# Altium project Main_Board.PrjPcb (part 9 of 44)

## Sheet JESD204_B_or_C.SchDoc: JESD204_B
size A3; Organization: Altium Limited; Address1: L3, 12a Rodborough Rd; Address2: Frenchs Forest; Address3: NSW; Address4: Australia 2086
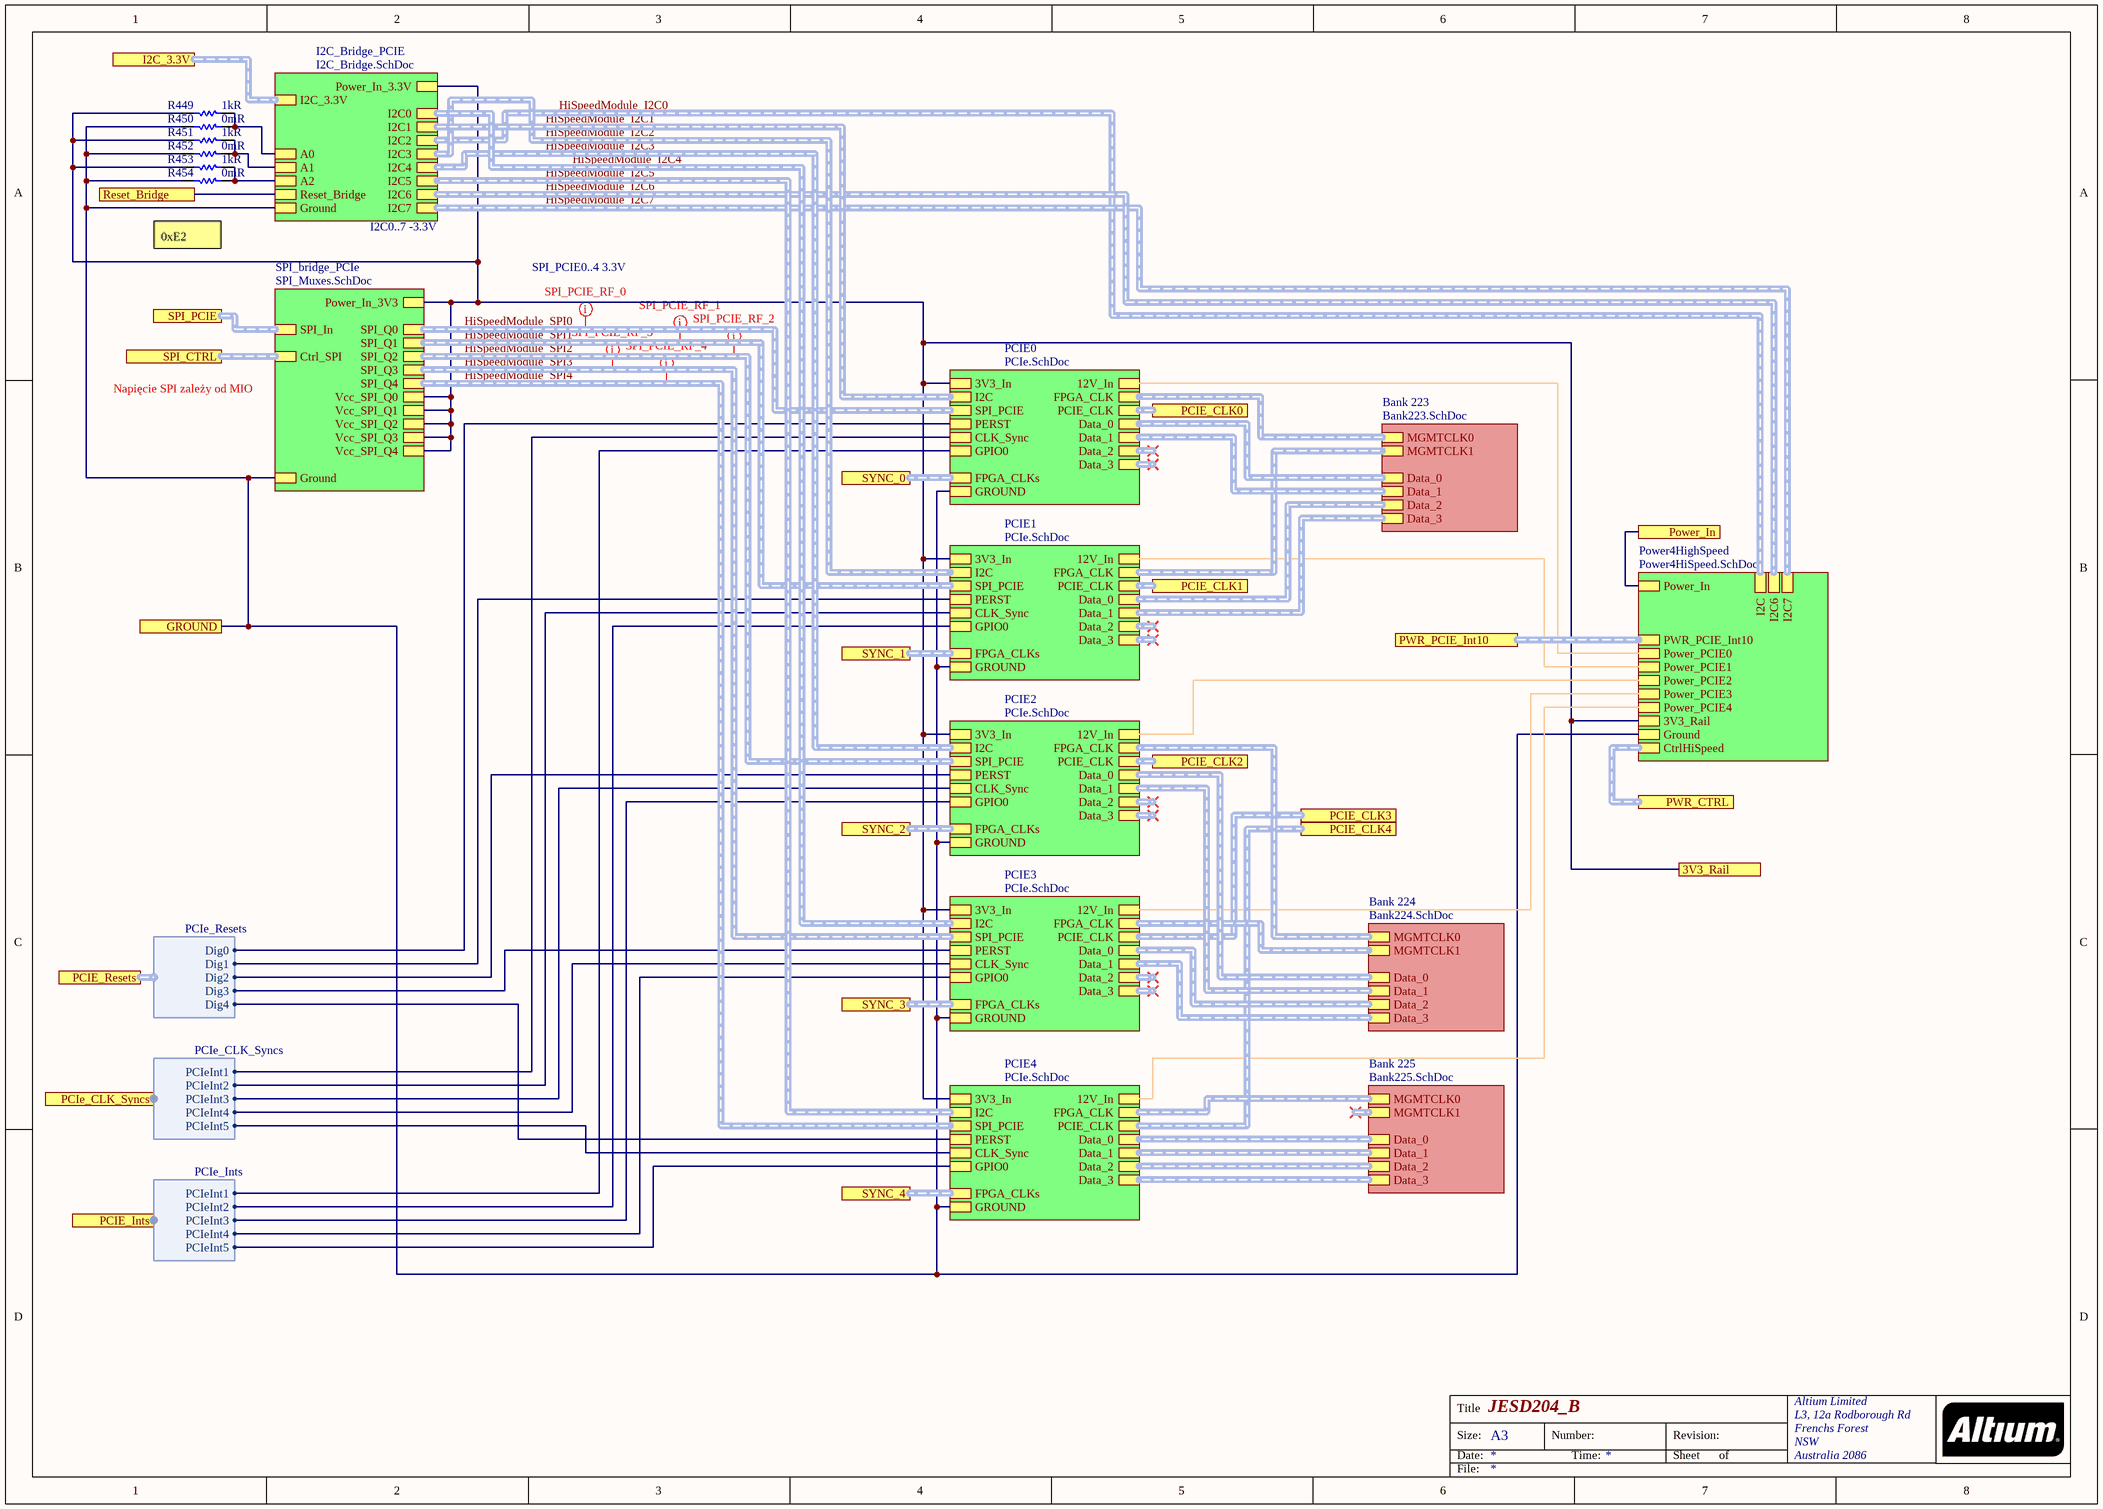
[diagram p11: JESD204_B_or_C.SchDoc]

### Parts
R449  1kR  [RES 0402/1005 RF KK]
R450  0mR  [RES 0402/1005 RF KK]
R451  1kR  [RES 0402/1005 RF KK]
R452  0mR  [RES 0402/1005 RF KK]
R453  1kR  [RES 0402/1005 RF KK]
R454  0mR  [RES 0402/1005 RF KK]

### Sub-sheets
Bank 223 = Bank223.SchDoc: MGMTCLK0 (harness Diff_1Pair), MGMTCLK1 (harness Diff_1Pair), Data_3 (harness Diff_2PairData), Data_2 (harness Diff_2PairData), Data_1 (harness Diff_2PairData), Data_0 (harness Diff_2PairData)
Bank 224 = Bank224.SchDoc: MGMTCLK0 (harness Diff_1Pair), MGMTCLK1 (harness Diff_1Pair), Data_3 (harness Diff_2PairData), Data_2 (harness Diff_2PairData), Data_1 (harness Diff_2PairData), Data_0 (harness Diff_2PairData)
Bank 225 = Bank225.SchDoc: Data_3 (harness Diff_2PairData), MGMTCLK0 (harness Diff_1Pair), Data_2 (harness Diff_2PairData), Data_1 (harness Diff_2PairData), Data_0 (harness Diff_2PairData), MGMTCLK1 (harness Diff_1Pair)
I2C_Bridge_PCIE = I2C_Bridge.SchDoc: I2C0 (harness I2C), I2C1 (harness I2C), I2C2 (harness I2C), I2C3 (harness I2C), I2C4 (harness I2C), I2C5 (harness I2C), I2C6 (harness I2C), I2C7 (harness I2C), Ground, A2, A1, A0, I2C_3.3V (harness I2C), Reset_Bridge, Power_In_3.3V
PCIE0 = PCIe.SchDoc: 12V_In, I2C (harness I2C), PERST, Data_0 (harness Diff_2PairData), Data_1 (harness Diff_2PairData), Data_2 (harness Diff_2PairData), Data_3 (harness Diff_2PairData), SPI_PCIE (harness SPI_H), 3V3_In, GROUND, FPGA_CLKs (harness Diff_3Diff_Pcie), PCIE_CLK (harness Diff_1Pair), CLK_Sync, GPIO0, FPGA_CLK (harness Diff_1Pair)
PCIE1 = PCIe.SchDoc: 12V_In, I2C (harness I2C), PCIE_CLK (harness Diff_1Pair), PERST, Data_0 (harness Diff_2PairData), Data_1 (harness Diff_2PairData), Data_2 (harness Diff_2PairData), Data_3 (harness Diff_2PairData), SPI_PCIE (harness SPI_H), 3V3_In, GROUND, FPGA_CLKs (harness Diff_3Diff_Pcie), CLK_Sync, GPIO0, FPGA_CLK (harness Diff_1Pair)
PCIE2 = PCIe.SchDoc: 12V_In, I2C (harness I2C), PCIE_CLK (harness Diff_1Pair), PERST, Data_0 (harness Diff_2PairData), Data_1 (harness Diff_2PairData), Data_2 (harness Diff_2PairData), Data_3 (harness Diff_2PairData), SPI_PCIE (harness SPI_H), 3V3_In, GROUND, FPGA_CLKs (harness Diff_3Diff_Pcie), CLK_Sync, GPIO0, FPGA_CLK (harness Diff_1Pair)
PCIE3 = PCIe.SchDoc: 12V_In, I2C (harness I2C), PCIE_CLK (harness Diff_1Pair), PERST, Data_0 (harness Diff_2PairData), Data_1 (harness Diff_2PairData), Data_2 (harness Diff_2PairData), Data_3 (harness Diff_2PairData), SPI_PCIE (harness SPI_H), 3V3_In, GROUND, FPGA_CLKs (harness Diff_3Diff_Pcie), CLK_Sync, GPIO0, FPGA_CLK (harness Diff_1Pair)
PCIE4 = PCIe.SchDoc: 12V_In, I2C (harness I2C), PCIE_CLK (harness Diff_1Pair), PERST, Data_0 (harness Diff_2PairData), Data_1 (harness Diff_2PairData), Data_2 (harness Diff_2PairData), Data_3 (harness Diff_2PairData), SPI_PCIE (harness SPI_H), 3V3_In, FPGA_CLKs (harness Diff_3Diff_Pcie), GROUND, CLK_Sync, GPIO0, FPGA_CLK (harness Diff_1Pair)
Power4HighSpeed = Power4HiSpeed.SchDoc: Power_In, Power_PCIE0, Power_PCIE1, Power_PCIE2, Power_PCIE3, Power_PCIE4, CtrlHiSpeed (harness Ctrl_Pwr4HiSpeed), Ground, I2C (harness I2C), 3V3_Rail, PWR_PCIE_Int10 (harness PWR_PCIE_Int10), I2C6, I2C7
SPI_bridge_PCIe = SPI_Muxes.SchDoc: SPI_Q0 (harness SPI_H), SPI_Q1 (harness SPI_H), SPI_Q2 (harness SPI_H), SPI_Q3 (harness SPI_H), SPI_Q4 (harness SPI_H), SPI_In (harness SPI_H), Power_In_3V3, Ctrl_SPI (harness Ctrl_SPI_PCIE), Vcc_SPI_Q4, Vcc_SPI_Q3, Vcc_SPI_Q2, Vcc_SPI_Q1, Vcc_SPI_Q0, Ground

### Ports
3V3_Rail, GROUND, I2C_3.3V (harness I2C), PCIE_CLK0 (harness Diff_1Pair), PCIE_CLK1 (harness Diff_1Pair), PCIE_CLK2 (harness Diff_1Pair), PCIE_CLK3 (harness Diff_1Pair), PCIE_CLK4 (harness Diff_1Pair), PCIe_CLK_Syncs (harness PCIe_CLK_Syncs), PCIE_Ints (harness PCIe_Ints), PCIE_Resets (harness PCIe_Resets), Power_In, PWR_CTRL (harness Ctrl_Pwr4HiSpeed), PWR_PCIE_Int10 (harness PWR_PCIE_Int10), Reset_Bridge, SPI_CTRL (harness Ctrl_SPI_PCIE), SPI_PCIE (harness SPI_H), SYNC_0 (harness Diff_3Diff_Pcie), SYNC_1 (harness Diff_3Diff_Pcie), SYNC_2 (harness Diff_3Diff_Pcie), SYNC_3 (harness Diff_3Diff_Pcie), SYNC_4 (harness Diff_3Diff_Pcie)

### Harnesses
PCIe_Resets: Dig0, Dig1, Dig2, Dig3, Dig4
PCIe_CLK_Syncs: PCIeInt1, PCIeInt2, PCIeInt3, PCIeInt4, PCIeInt5
PCIe_Ints: PCIeInt1, PCIeInt2, PCIeInt3, PCIeInt4, PCIeInt5

### Nets
B503_Ground: R450.2 R452.2 R454.2 ; port GROUND, sheet PCIE0/GROUND, sheet PCIE1/GROUND, sheet PCIE2/GROUND, sheet PCIE3/GROUND, sheet PCIE4/GROUND, sheet I2C_Bridge_PCIE/Ground, sheet SPI_bridge_PCIe/Ground, sheet Power4HighSpeed/Ground
3V3_RAIL: R449.1 R451.1 R453.1 ; port 3V3_Rail, sheet PCIE0/3V3_In, sheet PCIE1/3V3_In, sheet PCIE2/3V3_In, sheet PCIE3/3V3_In, sheet PCIE4/3V3_In, sheet I2C_Bridge_PCIE/Power_In_3.3V, sheet SPI_bridge_PCIe/Power_In_3V3, sheet SPI_bridge_PCIe/Vcc_SPI_Q4, sheet SPI_bridge_PCIe/Vcc_SPI_Q3, sheet SPI_bridge_PCIe/Vcc_SPI_Q2, sheet SPI_bridge_PCIe/Vcc_SPI_Q1, sheet SPI_bridge_PCIe/Vcc_SPI_Q0, sheet Power4HighSpeed/3V3_Rail
12V_LT3042: port Power_In, sheet Power4HighSpeed/Power_In
12V_PCIE0_CM: sheet PCIE0/12V_In, sheet Power4HighSpeed/Power_PCIE0
12V_PCIE1_CM: sheet PCIE1/12V_In, sheet Power4HighSpeed/Power_PCIE1
12V_PCIE2_CM: sheet PCIE2/12V_In, sheet Power4HighSpeed/Power_PCIE2
12V_PCIE3_CM: sheet PCIE3/12V_In, sheet Power4HighSpeed/Power_PCIE3
12V_PCIE4_CM: sheet PCIE4/12V_In, sheet Power4HighSpeed/Power_PCIE4
GPIOa_02.GPIO0: sheet PCIE0/PERST, port PCIE_Resets.Dig0
GPIOa_11.GPIO1: sheet PCIE1/PERST, port PCIE_Resets.Dig1
GPIOb_02.GPIO0: port Reset_Bridge, sheet I2C_Bridge_PCIE/Reset_Bridge
GPIOb_02.GPIO2: sheet PCIE3/PERST, port PCIE_Resets.Dig3
GPIOb_10.GPIO6: sheet PCIE2/PERST, port PCIE_Resets.Dig2
GPIOb_11.GPIO1: sheet PCIE4/PERST, port PCIE_Resets.Dig4
NetJ1_PCIE0_20: sheet PCIE0/CLK_Sync, port PCIe_CLK_Syncs.PCIeInt1
NetJ1_PCIE0_43: sheet PCIE0/GPIO0, port PCIE_Ints.PCIeInt1
NetJ1_PCIE1_20: sheet PCIE1/CLK_Sync, port PCIe_CLK_Syncs.PCIeInt2
NetJ1_PCIE1_43: sheet PCIE1/GPIO0, port PCIE_Ints.PCIeInt2
NetJ1_PCIE2_20: sheet PCIE2/CLK_Sync, port PCIe_CLK_Syncs.PCIeInt3
NetJ1_PCIE2_43: sheet PCIE2/GPIO0, port PCIE_Ints.PCIeInt3
NetJ1_PCIE3_20: sheet PCIE3/CLK_Sync, port PCIe_CLK_Syncs.PCIeInt4
NetJ1_PCIE3_43: sheet PCIE3/GPIO0, port PCIE_Ints.PCIeInt4
NetJ1_PCIE4_20: sheet PCIE4/CLK_Sync, port PCIe_CLK_Syncs.PCIeInt5
NetJ1_PCIE4_43: sheet PCIE4/GPIO0, port PCIE_Ints.PCIeInt5
NetR449_2: R449.2 R450.1 ; sheet I2C_Bridge_PCIE/A0
NetR451_2: R451.2 R452.1 ; sheet I2C_Bridge_PCIE/A1
NetR453_2: R453.2 R454.1 ; sheet I2C_Bridge_PCIE/A2

### Buses and harness runs
harness HiSpeedModule_I2C0 = sheet I2C_Bridge_PCIE/I2C2 = sheet Power4HighSpeed/I2C
harness HiSpeedModule_I2C1 = sheet I2C_Bridge_PCIE/I2C1 = sheet PCIE0/I2C
harness HiSpeedModule_I2C2 = sheet I2C_Bridge_PCIE/I2C3 = sheet PCIE1/I2C
harness HiSpeedModule_I2C3 = sheet I2C_Bridge_PCIE/I2C4 = sheet PCIE2/I2C
harness HiSpeedModule_I2C4 = sheet I2C_Bridge_PCIE/I2C0 = sheet PCIE3/I2C
harness HiSpeedModule_I2C5 = sheet I2C_Bridge_PCIE/I2C5 = sheet PCIE4/I2C
harness HiSpeedModule_I2C6 = sheet I2C_Bridge_PCIE/I2C6 = sheet Power4HighSpeed/I2C6
harness HiSpeedModule_I2C7 = sheet I2C_Bridge_PCIE/I2C7 = sheet Power4HighSpeed/I2C7
harness HiSpeedModule_SPI0 = sheet PCIE0/SPI_PCIE = sheet SPI_bridge_PCIe/SPI_Q0
harness HiSpeedModule_SPI1 = sheet PCIE1/SPI_PCIE = sheet SPI_bridge_PCIe/SPI_Q1
harness HiSpeedModule_SPI2 = sheet PCIE2/SPI_PCIE = sheet SPI_bridge_PCIe/SPI_Q2
harness HiSpeedModule_SPI3 = sheet PCIE3/SPI_PCIE = sheet SPI_bridge_PCIe/SPI_Q3
harness HiSpeedModule_SPI4 = sheet PCIE4/SPI_PCIE = sheet SPI_bridge_PCIe/SPI_Q4
harness port I2C_3.3V = sheet I2C_Bridge_PCIE/I2C_3.3V
harness port PCIE_CLK0 = sheet PCIE0/PCIE_CLK
harness port PCIE_CLK1 = sheet PCIE1/PCIE_CLK
harness port PCIE_CLK2 = sheet PCIE2/PCIE_CLK
harness port PCIE_CLK3 = sheet PCIE3/PCIE_CLK
harness port PCIE_CLK4 = sheet PCIE4/PCIE_CLK
harness port PWR_CTRL = sheet Power4HighSpeed/CtrlHiSpeed
harness port PWR_PCIE_Int10 = sheet Power4HighSpeed/PWR_PCIE_Int10
harness port SPI_CTRL = sheet SPI_bridge_PCIe/Ctrl_SPI
harness port SPI_PCIE = sheet SPI_bridge_PCIe/SPI_In
harness port SYNC_0 = sheet PCIE0/FPGA_CLKs
harness port SYNC_1 = sheet PCIE1/FPGA_CLKs
harness port SYNC_2 = sheet PCIE2/FPGA_CLKs
harness port SYNC_3 = sheet PCIE3/FPGA_CLKs
harness port SYNC_4 = sheet PCIE4/FPGA_CLKs
harness sheet Bank 223/Data_0 = sheet PCIE0/Data_0
harness sheet Bank 223/Data_1 = sheet PCIE0/Data_1
harness sheet Bank 223/Data_2 = sheet PCIE1/Data_0
harness sheet Bank 223/Data_3 = sheet PCIE1/Data_1
harness sheet Bank 223/MGMTCLK0 = sheet PCIE0/FPGA_CLK
harness sheet Bank 223/MGMTCLK1 = sheet PCIE1/FPGA_CLK
harness sheet Bank 224/Data_0 = sheet PCIE2/Data_0
harness sheet Bank 224/Data_1 = sheet PCIE2/Data_1
harness sheet Bank 224/Data_2 = sheet PCIE3/Data_0
harness sheet Bank 224/Data_3 = sheet PCIE3/Data_1
harness sheet Bank 224/MGMTCLK0 = sheet PCIE2/FPGA_CLK
harness sheet Bank 224/MGMTCLK1 = sheet PCIE3/FPGA_CLK
harness sheet Bank 225/Data_0 = sheet PCIE4/Data_0
harness sheet Bank 225/Data_1 = sheet PCIE4/Data_1
harness sheet Bank 225/Data_2 = sheet PCIE4/Data_2
harness sheet Bank 225/Data_3 = sheet PCIE4/Data_3
harness sheet Bank 225/MGMTCLK0 = sheet PCIE4/FPGA_CLK

### Layout directives
net class SPI_PCIE_RF_0: (no net found under the mark)
net class SPI_PCIE_RF_1: (no net found under the mark)
net class SPI_PCIE_RF_2: (no net found under the mark)
net class SPI_PCIE_RF_3: (no net found under the mark)
net class SPI_PCIE_RF_4: (no net found under the mark)

### Notes on the sheet
- 0xE2
- I2C0..7 -3.3V
- SPI_PCIE0..4 3.3V
- Napięcie SPI zależy od MIO
- Title
- Size:
- Date:
- A3
- Number:
- Time:
- Revision:
- Sheet
- of
- File:

### Library data of the parts
R449 R451 R453 = Resistor: as R124 on sheet Ultrascale+_02; Supplier 1: Digi-Key; Supplier Part Number 1: P1.00KLDKR-ND; Manufacturer: Panasonic; Manufacturer Part Number: ERJ-2RKF1001X; RoHS: Yes; Category: Chip SMD Resistors; Stock 1: 1864188; Pricing 1: 1=0,10000, 10=0,04300, 100=0,01740, 1000=0,00782, 2500=0,00678, 5000=0,00561 (USD); Mount: Surface Mount; Case/Package: 0402; Number of Pins: 2; Contact Plating: Tin; Case Code (Imperial): 0402; Case Code (Metric): 1005; Min Operating Temperature: -55°C; Max Operating Temperature: 155°C; Composition: Thick Film; Resistance: 1kR; Termination: SMD/SMT; Number of Terminations: 2; Military Standard: Not; Features: Automotive AEC-Q200; Packaging: Tape and Reel; Voltage Rating: 50V; Package Quantity: 1; Max Power Dissipation: 100mW; Working Voltage: 50V; Length: 1mm; Height: 0.35mm; Depth: 0.5mm; Width: 0.5mm; Radiation Hardening: No; Lead Free: Lead Free; REACH SVHC: No SVHC; ComponentLink1URL: https://datasheet.ciiva.com/11821/0900766b80f80784-11821203.pdf?src-supplier=RSComponents; ComponentLink1Description: https://datasheet.ciiva.com/11821/0900766b80f80784-11821203.pdf?src-supplier=RSComponents; ComponentLink2URL: https://datasheet.ciiva.com/7942/aoa0000ce2-7942426.pdf?src-supplier=Element14; ComponentLink2Description: https://datasheet.ciiva.com/7942/aoa0000ce2-7942426.pdf?src-supplier=Element14; ComponentLink3URL: https://datasheet.ciiva.com/16523/aoa0000ce2-16523834.pdf?src-supplier=Avnet+Asia; ComponentLink3Description: https://datasheet.ciiva.com/16523/aoa0000ce2-16523834.pdf?src-supplier=Avnet+Asia; ComponentLink4URL: https://datasheet.ciiva.com/17215/aoa0000ce2-17215308.pdf?src-supplier=Avnet+Europe; ComponentLink4Description: https://datasheet.ciiva.com/17215/aoa0000ce2-17215308.pdf?src-supplier=Avnet+Europe; ComponentLink5URL: https://datasheet.ciiva.com/22673/1678782-22673916.pdf?src-supplier=Element14; ComponentLink5Description: https://datasheet.ciiva.com/22673/1678782-22673916.pdf?src-supplier=Element14; ComponentLink6URL: https://datasheet.ciiva.com/28532/1678782-28532109.pdf?src-supplier=Element14; ComponentLink6Description: https://datasheet.ciiva.com/28532/1678782-28532109.pdf?src-supplier=Element14; ComponentLink7URL: https://datasheet.ciiva.com/16767/70260748-16767559.pdf?src-supplier=Allied+Electronics; ComponentLink7Description: https://datasheet.ciiva.com/16767/70260748-16767559.pdf?src-supplier=Allied+Electronics; ComponentLink8URL: https://datasheet.ciiva.com/9198/aoa0000ce2-9198920.pdf?src-supplier=Avnet; ComponentLink8Description: https://datasheet.ciiva.com/9198/aoa0000ce2-9198920.pdf?src-supplier=Avnet; ComponentLink9URL: https://datasheet.ciiva.com/16771/70260748-16771979.pdf?src-supplier=Allied+Electronics; ComponentLink9Description: https://datasheet.ciiva.com/16771/70260748-16771979.pdf?src-supplier=Allied+Electronics
R450 R452 R454 = Resistor: as R539 on sheet LTC6952; Supplier 1: Digi-Key; Supplier Part Number 1: 311-0.0JRCT-ND; Stock 1: 69822252; Pricing 1: 1=0.10000, 10=0.01200, 25=0.00920, 50=0.00680, 100=0.00510, 250=0.00388, 500=0.00308, 1000=0.00227, 5000=0.00163 (USD); RoHS: Yes; Case/Package: 0402; Contact Plating: Tin,Matte; Case Code (Metric): 1005; Case Code (Imperial): 0402; Min Operating Temperature: -55°C; Max Operating Temperature: 155°C; Resistance: 0mR; Packaging: Tape and Reel; Composition: Thick Film; Package Quantity: 1; Number of Terminations: 2; Termination: SMD/SMT; Military Standard: Not; Features: Moisture Resistant; Length: 1mm; Height: 0.016inch; Width: 0.02inch; Depth: 0.5mm; Radiation Hardening: No; REACH SVHC: Unknown; Lead Free: Lead Free; ComponentLink1URL: https://datasheet.ciiva.com/2452/pyu-rc0402-51-rohs-l-6-2452608.pdf?src-supplier=Digi-Key; ComponentLink1Description: https://datasheet.ciiva.com/2452/pyu-rc0402-51-rohs-l-6-2452608.pdf?src-supplier=Digi-Key; ComponentLink2URL: https://datasheet.ciiva.com/11808/0900766b80c66297-11808195.pdf?src-supplier=RSComponents; ComponentLink2Description: https://datasheet.ciiva.com/11808/0900766b80c66297-11808195.pdf?src-supplier=RSComponents; ComponentLink3URL: https://datasheet.ciiva.com/2452/pyu-r-int-thick-7-2452609.pdf?src-supplier=Digi-Key; ComponentLink3Description: https://datasheet.ciiva.com/2452/pyu-r-int-thick-7-2452609.pdf?src-supplier=Digi-Key; ComponentLink4URL: https://datasheet.ciiva.com/22747/1018594-22747515.pdf?src-supplier=Element14; ComponentLink4Description: https://datasheet.ciiva.com/22747/1018594-22747515.pdf?src-supplier=Element14; ComponentLink5URL: https://datasheet.ciiva.com/7983/1018594-7983535.pdf?src-supplier=Element14; ComponentLink5Description: https://datasheet.ciiva.com/7983/1018594-7983535.pdf?src-supplier=Element14; ComponentLink6URL: https://datasheet.ciiva.com/2452/pyu-r-int-thick-7-2452610.pdf?src-supplier=Digi-Key; ComponentLink6Description: https://datasheet.ciiva.com/2452/pyu-r-int-thick-7-2452610.pdf?src-supplier=Digi-Key; ComponentLink7URL: https://datasheet.ciiva.com/8896/pyu-rc0402-51-rohs-l-6-8896201.pdf?src-supplier=Avnet; ComponentLink7Description: https://datasheet.ciiva.com/8896/pyu-rc0402-51-rohs-l-6-8896201.pdf?src-supplier=Avnet; ComponentLink8URL: https://datasheet.ciiva.com/28386/pyu-rc0402-51-rohs-l-6-28386633.pdf?src-supplier=Avnet+Europe; ComponentLink8Description: https://datasheet.ciiva.com/28386/pyu-rc0402-51-rohs-l-6-28386633.pdf?src-supplier=Avnet+Europe; ComponentLink9URL: https://datasheet.ciiva.com/15189/getdatasheetpartid-326379-15189533.pdf?src-supplier=Verical; ComponentLink9Description: https://datasheet.ciiva.com/15189/getdatasheetpartid-326379-15189533.pdf?src-supplier=Verical

## Sheet PCIe.SchDoc: PCIe
size A3; Organization: Altium Limited; Address1: L3, 12a Rodborough Rd; Address2: Frenchs Forest; Address3: NSW; Address4: Australia 2086
Used 5 times, as channels HighSpeed/PCIE0, HighSpeed/PCIE1, HighSpeed/PCIE2, HighSpeed/PCIE3, HighSpeed/PCIE4. Parts and nets are listed once, with the designators drawn on the sheet.
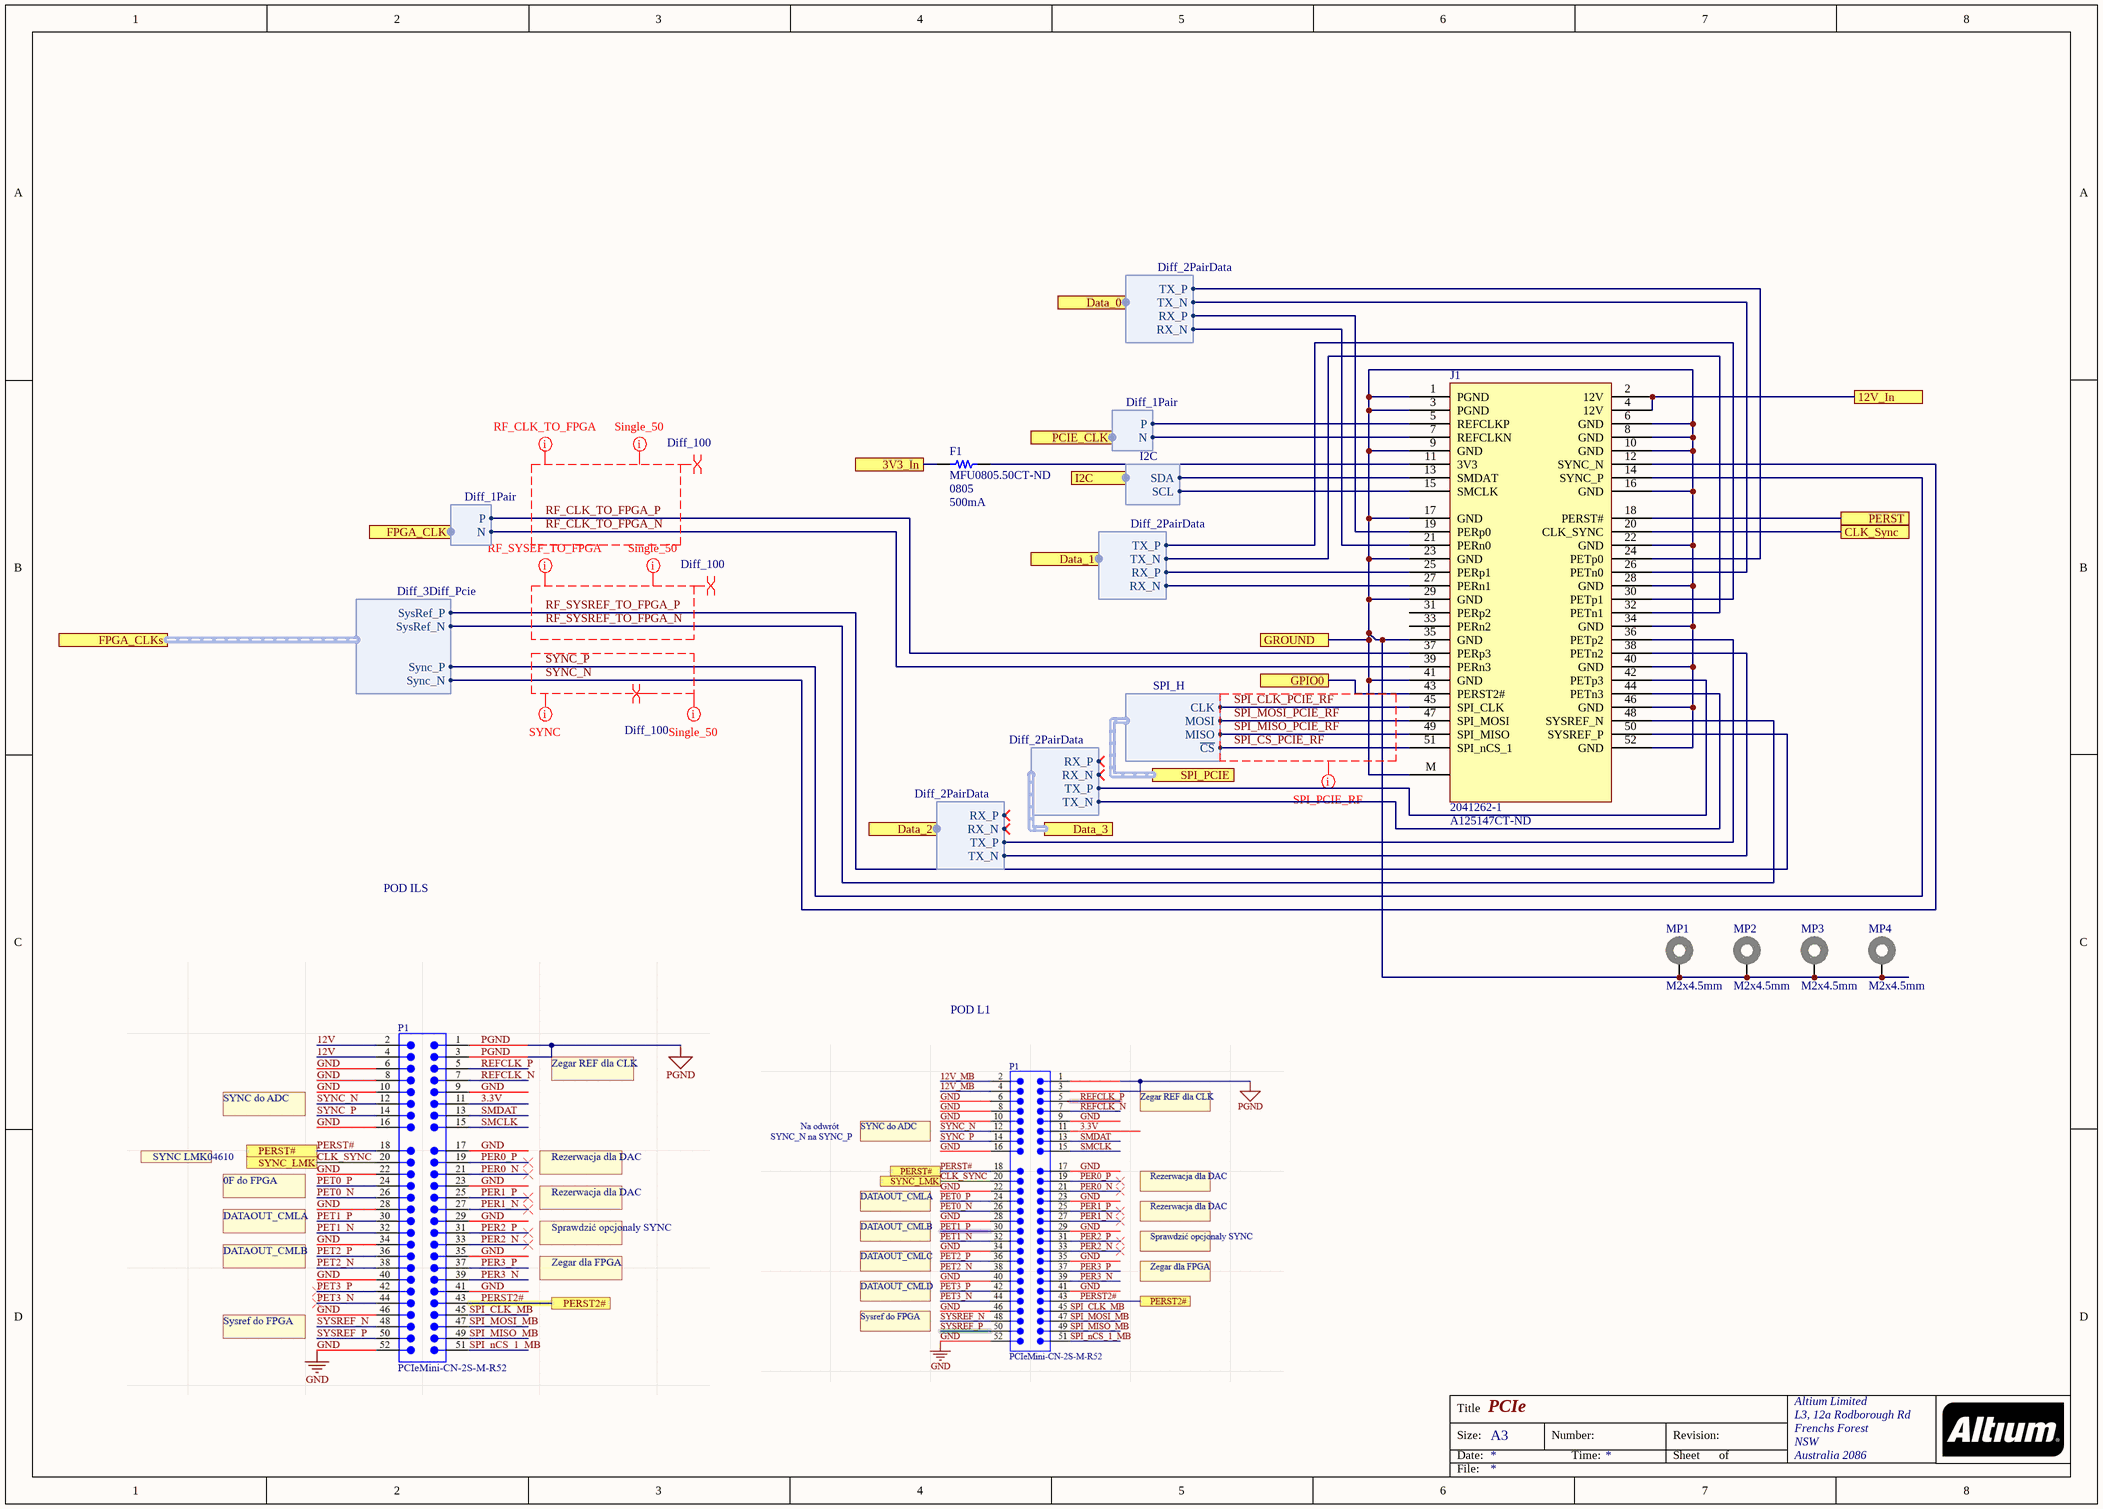
[diagram p12: PCIe.SchDoc]

### Parts
F1  Supplier Part Number 1: MFU0805.50CT-ND  Case Code (Imperial): 0805  Fuse Current: 500mA  [RES 0805/2012 RF]
J1  2041262-1  Supplier Part Number 1: A125147CT-ND  [PCI Express / PCI Connectors Mini PCI-E 6.8H G/F]
MP1  M2x4.5mm  [9774045243 - dual side copper]
MP2  M2x4.5mm  [9774045243 - dual side copper]
MP3  M2x4.5mm  [9774045243 - dual side copper]
MP4  M2x4.5mm  [9774045243 - dual side copper]

### Ports
3V3_In, 12V_In, CLK_Sync, Data_0 (harness Diff_2PairData), Data_1 (harness Diff_2PairData), Data_2 (harness Diff_2PairData), Data_3 (harness Diff_2PairData), FPGA_CLK (harness Diff_1Pair), FPGA_CLKs (harness Diff_3Diff_Pcie), GPIO0, GROUND, I2C (harness I2C), PCIE_CLK (harness Diff_1Pair), PERST, SPI_PCIE (harness SPI_H)

### Harnesses
I2C: SDA, SCL
SPI_H: CLK, MISO, MOSI, ~{CS}
Diff_2PairData: RX_P, RX_N, TX_P, TX_N
Diff_1Pair: N, P
Diff_3Diff_Pcie: SysRef_N, SysRef_P, Sync_P, Sync_N

### Nets
3V3_In: F1.2 ; port 3V3_In
12V_In: J1.2(12V) J1.4(12V) ; port 12V_In
CLK_Sync: J1.20(CLK_SYNC) ; port CLK_Sync
GPIO0: J1.43(PERST2#) ; port GPIO0
GROUND: J1.1(PGND) J1.3(PGND) J1.6(GND) J1.8(GND) J1.9(GND) J1.10(GND) J1.16(GND) J1.17(GND) J1.22(GND) J1.23(GND) J1.28(GND) J1.29(GND) J1.34(GND) J1.35(GND) J1.40(GND) J1.41(GND) J1.46(GND) J1.52(GND) J1.M MP1.1 MP2.1 MP3.1 MP4.1 ; port GROUND
PERST: J1.18(PERST#) ; port PERST
RF_CLK_TO_FPGA_N: J1.39(PERn3) ; port FPGA_CLK.N
RF_CLK_TO_FPGA_P: J1.37(PERp3) ; port FPGA_CLK.P
RF_SYSREF_TO_FPGA_N: J1.48(SYSREF_N) ; port FPGA_CLKs.SysRef_N
RF_SYSREF_TO_FPGA_P: J1.50(SYSREF_P) ; port FPGA_CLKs.SysRef_P
SPI_~{CS}_PCIE_RF: J1.51(SPI_nCS_1) ; port SPI_PCIE.~{CS}
SPI_CLK_PCIE_RF: J1.45(SPI_CLK) ; port SPI_PCIE.CLK
SPI_MISO_PCIE_RF: J1.49(SPI_MISO) ; port SPI_PCIE.MISO
SPI_MOSI_PCIE_RF: J1.47(SPI_MOSI) ; port SPI_PCIE.MOSI
SYNC_N: J1.12(SYNC_N) ; port FPGA_CLKs.Sync_N
SYNC_P: J1.14(SYNC_P) ; port FPGA_CLKs.Sync_P
NetF1_1: F1.1 J1.11(3V3)
NetJ1_5: J1.5(REFCLKP) ; port PCIE_CLK.P
NetJ1_7: J1.7(REFCLKN) ; port PCIE_CLK.N
NetJ1_13: J1.13(SMDAT) ; port I2C.SDA
NetJ1_15: J1.15(SMCLK) ; port I2C.SCL
NetJ1_19: J1.19(PERp0) ; port Data_0.RX_P
NetJ1_21: J1.21(PERn0) ; port Data_0.RX_N
NetJ1_24: J1.24(PETp0) ; port Data_0.TX_P
NetJ1_25: J1.25(PERp1) ; port Data_1.RX_P
NetJ1_26: J1.26(PETn0) ; port Data_0.TX_N
NetJ1_27: J1.27(PERn1) ; port Data_1.RX_N
NetJ1_30: J1.30(PETp1) ; port Data_1.TX_P
NetJ1_32: J1.32(PETn1) ; port Data_1.TX_N
NetJ1_36: J1.36(PETp2) ; port Data_2.TX_P
NetJ1_38: J1.38(PETn2) ; port Data_2.TX_N
NetJ1_42: J1.42(PETp3) ; port Data_3.TX_P
NetJ1_44: J1.44(PETn3) ; port Data_3.TX_N

Not connected (* = marked no-connect by the designer): J1 31(PERp2) 33(PERn2)

### Channels
HighSpeed/PCIE0: designators end in _PCIE0; ports 3V3_In=3V3_RAIL 12V_In=12V_PCIE0_CM CLK_Sync=NetJ1_PCIE0_20 GPIO0=NetJ1_PCIE0_43 GROUND=B503_Ground PERST=GPIOa_02.GPIO0
HighSpeed/PCIE1: designators end in _PCIE1; ports 3V3_In=3V3_RAIL 12V_In=12V_PCIE1_CM CLK_Sync=NetJ1_PCIE1_20 GPIO0=NetJ1_PCIE1_43 GROUND=B503_Ground PERST=GPIOa_11.GPIO1
HighSpeed/PCIE2: designators end in _PCIE2; ports 3V3_In=3V3_RAIL 12V_In=12V_PCIE2_CM CLK_Sync=NetJ1_PCIE2_20 GPIO0=NetJ1_PCIE2_43 GROUND=B503_Ground PERST=GPIOb_10.GPIO6
HighSpeed/PCIE3: designators end in _PCIE3; ports 3V3_In=3V3_RAIL 12V_In=12V_PCIE3_CM CLK_Sync=NetJ1_PCIE3_20 GPIO0=NetJ1_PCIE3_43 GROUND=B503_Ground PERST=GPIOb_02.GPIO2
HighSpeed/PCIE4: designators end in _PCIE4; ports 3V3_In=3V3_RAIL 12V_In=12V_PCIE4_CM CLK_Sync=NetJ1_PCIE4_20 GPIO0=NetJ1_PCIE4_43 GROUND=B503_Ground PERST=GPIOb_11.GPIO1

### Layout directives
mark named RF_CLK_TO_FPGA: RF_CLK_TO_FPGA_N, RF_CLK_TO_FPGA_P
net class RF_SYSEF_TO_FPGA*: RF_SYSREF_TO_FPGA_N, RF_SYSREF_TO_FPGA_P
net class SYNC: SYNC_N, SYNC_P
differential pair; differential pair class Diff_100: RF_CLK_TO_FPGA_N, RF_CLK_TO_FPGA_P, RF_SYSREF_TO_FPGA_N, RF_SYSREF_TO_FPGA_P, SYNC_N, SYNC_P
net class Single_50: RF_CLK_TO_FPGA_N, RF_CLK_TO_FPGA_P, RF_SYSREF_TO_FPGA_N, RF_SYSREF_TO_FPGA_P, SYNC_N, SYNC_P
net class SPI_PCIE_RF: SPI_CLK_PCIE_RF, SPI_MISO_PCIE_RF, SPI_MOSI_PCIE_RF, SPI_~{CS}_PCIE_RF

### Notes on the sheet
- POD ILS
- POD L1
- Title
- Size:
- Date:
- A3
- Number:
- Time:
- Revision:
- Sheet
- of
- File:

### Library data of the parts
F1 = Resistor: FUSE BOARD MNT 500MA 32VDC 0805; Manufacturer: Vishay; Manufacturer Part Number: MFU0805FF00500P100; DC Cold Resistance: 570mR; Working Voltage: 32V; Fuse Type: Board Mount (Cartridge Style Excluded); Approvals: UL; Supplier 1: Digi-Key; RoHS: Yes; Category: Fuses; Stock 1: 14752; Pricing 1: 1=0,63000, 5=0,60800, 10=0,58900, 50=0,49560, 100=0,41140, 250=0,37400, 500=0,31790 (USD); Mount: Surface Mount; Case/Package: SMD/SMT; Number of Pins: 2; Case Code (Metric): 2012; Housing Material: Ceramic; Min Operating Temperature: -55°C; Max Operating Temperature: 125°C; Current Rating: 500mA; Package Quantity: 1000; Voltage Rating (DC): 32V; Packaging: Tape and Reel; Length: 0.079inch; Height: 0.018inch; Depth: 1.25mm; Width: 0.049inch; Radiation Hardening: No; REACH SVHC: No SVHC; ComponentLink1URL: https://datasheet.ciiva.com/7650/mfuserie-7650777.pdf?src-supplier=Element14; ComponentLink1Description: https://datasheet.ciiva.com/7650/mfuserie-7650777.pdf?src-supplier=Element14; ComponentLink2URL: https://datasheet.ciiva.com/16393/mfuserie-16393883.pdf?src-supplier=Future+Electronics; ComponentLink2Description: https://datasheet.ciiva.com/16393/mfuserie-16393883.pdf?src-supplier=Future+Electronics; ComponentLink3URL: https://datasheet.ciiva.com/8057/1480005-8057902.pdf?src-supplier=Element14; ComponentLink3Description: https://datasheet.ciiva.com/8057/1480005-8057902.pdf?src-supplier=Element14; ComponentLink4URL: https://datasheet.ciiva.com/11337/mfuserie-11337759.pdf?src-supplier=Avnet; ComponentLink4Description: https://datasheet.ciiva.com/11337/mfuserie-11337759.pdf?src-supplier=Avnet
J1 = 2041262-1: PCI Express / PCI Connectors Mini PCI-E 6.8H G/F; Manufacturer: TE Connectivity AMP; Connector Type: Receptacle; Number of Contacts: 52; High Temperature Housing: Yes; PCB Mount Retention: Without; PCB Mounting Orientation: Horizontal; Stackable: No; Pitch: 0.8mm; Row Spacing: 0.031inch; Stack Height: 0.268inch; Supplier 1: Digi-Key; Manufacturer Part Number: 2041262-1; RoHS: Yes; Category: Card Edge Connectors; Stock 1: 33744; Pricing 1: 1=1,04000, 10=0,91200, 25=0,85840, 50=0,82260, 100=0,78680 (USD); Mount: Surface Mount; Number of Pins: 52; Housing Material: Thermoplastic; Contact Material: Copper Alloy; Housing Color: Black; Contact Plating: Gold; Min Operating Temperature: -55°C; Max Operating Temperature: 85°C; Number of Rows: 2; Termination: Solder; Number of Positions: 52; Package Quantity: 450; Orientation: Right Angle; Packaging: Tape and Reel; Flammability Rating: UL94 V-0; Lead Free: Lead Free; ELV: Compliant; ComponentLink1URL: https://www.mouser.com/ds/2/418/NG_DS_8-1773459-7_EXPRESS_MINI_CARD_QRG_0816-907003.pdf?src-supplier=Mouser; ComponentLink1Description: https://www.mouser.com/ds/2/418/NG_DS_8-1773459-7_EXPRESS_MINI_CARD_QRG_0816-907003.pdf?src-supplier=Mouser; ComponentLink2URL: https://www.te.com/commerce/DocumentDelivery/DDEController?Action=srchrtrv&DocNm=108-99102&DocType=SS&DocLang=EN&src-supplier=Digi-Key; ComponentLink2Description: https://www.te.com/commerce/DocumentDelivery/DDEController?Action=srchrtrv&DocNm=108-99102&DocType=SS&DocLang=EN&src-supplier=Digi-Key; ComponentLink3URL: https://www.te.com/commerce/DocumentDelivery/DDEController?Action=srchrtrv&amp;DocNm=2041262&amp;DocType=Customer+Drawing&amp;DocLang=English&src-supplier=Digi-Key; ComponentLink3Description: https://www.te.com/commerce/DocumentDelivery/DDEController?Action=srchrtrv&amp;DocNm=2041262&amp;DocType=Customer+Drawing&amp;DocLang=English&src-supplier=Digi-Key; ComponentLink4URL: http://www.te.com/commerce/DocumentDelivery/DDEController?Action=srchrtrv&DocNm=2041262&DocType=Customer+Drawing&DocLang=English&src-supplier=Digi-Key; ComponentLink4Description: http://www.te.com/commerce/DocumentDelivery/DDEController?Action=srchrtrv&DocNm=2041262&DocType=Customer+Drawing&DocLang=English&src-supplier=Digi-Key; ComponentLink5URL: http://www.te.com/commerce/DocumentDelivery/DDEController?Action=showdoc&DocId=Customer+Drawing%7F2041262%7FC%7Fpdf%7FEnglish%7FENG_CD_2041262_C.pdf&src-supplier=Avnet; ComponentLink5Description: http://www.te.com/commerce/DocumentDelivery/DDEController?Action=showdoc&DocId=Customer+Drawing%7F2041262%7FC%7Fpdf%7FEnglish%7FENG_CD_2041262_C.pdf&src-supplier=Avnet
MP1-MP4 = 9774045243R: WA-SMSI SMT Steel Spacer, OD4.35mm, M2x4.5mm; Inner Diameter: 2.8mm; Outer Diameter: 4.35mm; Surface: Tin; Thread: M2; ComponentLink1Description: Manufacturer; ComponentLink1URL: http://www.we-online.de; ComponentLink2Description: Datasheet; ComponentLink2URL: https://katalog.we-online.com/em/datasheet/9774045243R.pdf; Mounting Technology: SMT; Packaging: Tape and Reel; Part Number: 9774045243R; Length: 4.5mm; Inner Thread Length: -; Operating Temperature: -55 to +150degC; Publisher: Wurth Elektronik; Published Date: September 2019; Material: Steel

## Sheet Bank224.SchDoc: Bank224
size A3; Organization: Altium Limited; Address1: L3, 12a Rodborough Rd; Address2: Frenchs Forest; Address3: NSW; Address4: Australia 2086
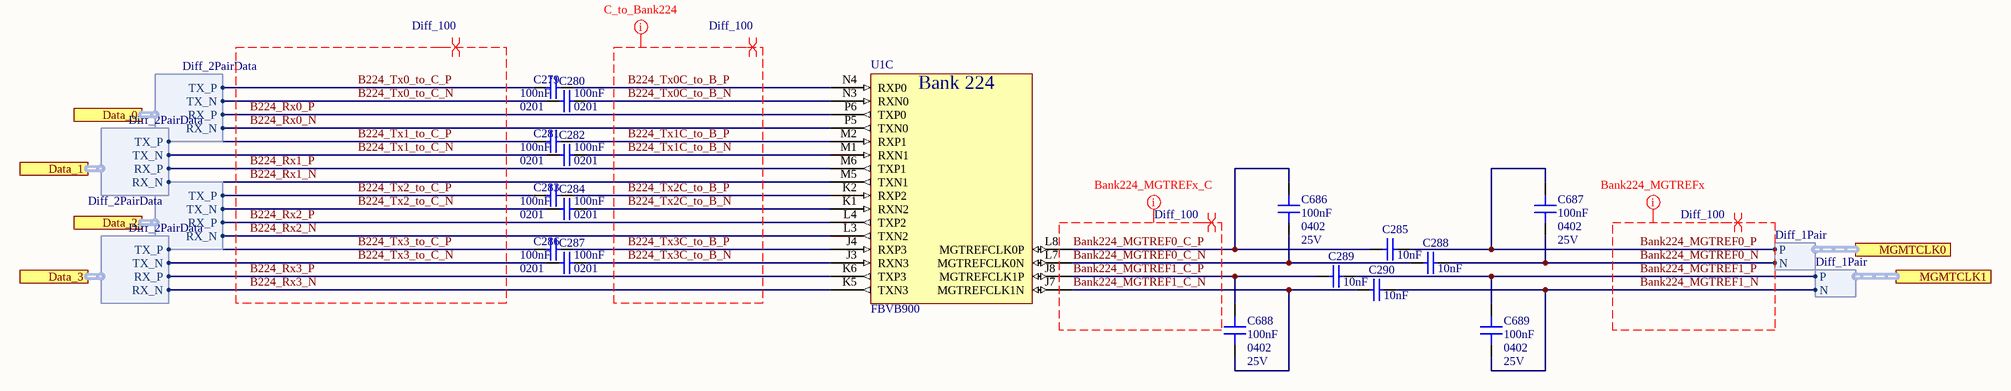
[diagram p13: Bank224.SchDoc]

### Parts
C279  100nF  Case/Package: 0201  [CAP 0201/0603 KK]
C280  100nF  Case/Package: 0201  [CAP 0201/0603 KK]
C281  100nF  Case/Package: 0201  [CAP 0201/0603 KK]
C282  100nF  Case/Package: 0201  [CAP 0201/0603 KK]
C283  100nF  Case/Package: 0201  [CAP 0201/0603 KK]
C284  100nF  Case/Package: 0201  [CAP 0201/0603 KK]
C285  10nF  [CAP 0201/0603 KK]
C286  100nF  Case/Package: 0201  [CAP 0201/0603 KK]
C287  100nF  Case/Package: 0201  [CAP 0201/0603 KK]
C288  10nF  [CAP 0201/0603 KK]
C289  10nF  [CAP 0201/0603 KK]
C290  10nF  [CAP 0201/0603 KK]
C686  100nF  Case/Package: 0402  Voltage Rating: 25V  [CAP 0402/1005 KK]
C687  100nF  Case/Package: 0402  Voltage Rating: 25V  [CAP 0402/1005 KK]
C688  100nF  Case/Package: 0402  Voltage Rating: 25V  [CAP 0402/1005 KK]
C689  100nF  Case/Package: 0402  Voltage Rating: 25V  [CAP 0402/1005 KK]
U1  FBVB900  [FBVB900 XX]  (part C of 23)

### Ports
Data_0 (harness Diff_2PairData), Data_1 (harness Diff_2PairData), Data_2 (harness Diff_2PairData), Data_3 (harness Diff_2PairData), MGMTCLK0 (harness Diff_1Pair), MGMTCLK1 (harness Diff_1Pair)

### Harnesses
Diff_1Pair: P, N
Diff_2PairData: RX_P, RX_N, TX_P, TX_N

### Nets
B224_Rx0_N: U1.P5(TXN0) ; port Data_0.RX_N
B224_Rx0_P: U1.P6(TXP0) ; port Data_0.RX_P
B224_Rx1_N: U1.M5(TXN1) ; port Data_1.RX_N
B224_Rx1_P: U1.M6(TXP1) ; port Data_1.RX_P
B224_Rx2_N: U1.L3(TXN2) ; port Data_2.RX_N
B224_Rx2_P: U1.L4(TXP2) ; port Data_2.RX_P
B224_Rx3_N: U1.K5(TXN3) ; port Data_3.RX_N
B224_Rx3_P: U1.K6(TXP3) ; port Data_3.RX_P
B224_Tx0_to_C_N: C280.1 ; port Data_0.TX_N
B224_Tx0_to_C_P: C279.1 ; port Data_0.TX_P
B224_Tx0C_to_B_N: C280.2 U1.N3(RXN0)
B224_Tx0C_to_B_P: C279.2 U1.N4(RXP0)
B224_Tx1_to_C_N: C282.1 ; port Data_1.TX_N
B224_Tx1_to_C_P: C281.1 ; port Data_1.TX_P
B224_Tx1C_to_B_N: C282.2 U1.M1(RXN1)
B224_Tx1C_to_B_P: C281.2 U1.M2(RXP1)
B224_Tx2_to_C_N: C284.1 ; port Data_2.TX_N
B224_Tx2_to_C_P: C283.1 ; port Data_2.TX_P
B224_Tx2C_to_B_N: C284.2 U1.K1(RXN2)
B224_Tx2C_to_B_P: C283.2 U1.K2(RXP2)
B224_Tx3_to_C_N: C287.1 ; port Data_3.TX_N
B224_Tx3_to_C_P: C286.1 ; port Data_3.TX_P
B224_Tx3C_to_B_N: C287.2 U1.J3(RXN3)
B224_Tx3C_to_B_P: C286.2 U1.J4(RXP3)
Bank224_MGTREF0_C_N: C288.1 C686.2 U1.L7(MGTREFCLK0N)
Bank224_MGTREF0_C_P: C285.1 C686.1 U1.L8(MGTREFCLK0P)
Bank224_MGTREF0_N: C288.2 C687.2 ; port MGMTCLK0.N
Bank224_MGTREF0_P: C285.2 C687.1 ; port MGMTCLK0.P
Bank224_MGTREF1_C_N: C290.1 C688.2 U1.J7(MGTREFCLK1N)
Bank224_MGTREF1_C_P: C289.1 C688.1 U1.J8(MGTREFCLK1P)
Bank224_MGTREF1_N: C290.2 C689.2 ; port MGMTCLK1.N
Bank224_MGTREF1_P: C289.2 C689.1 ; port MGMTCLK1.P

### Layout directives
net class C_to_Bank224: B224_Tx0C_to_B_N, B224_Tx0C_to_B_P, B224_Tx1C_to_B_N, B224_Tx1C_to_B_P, B224_Tx2C_to_B_N, B224_Tx2C_to_B_P, B224_Tx3C_to_B_N, B224_Tx3C_to_B_P
net class Bank224_MGTREFx_C: Bank224_MGTREF0_C_N, Bank224_MGTREF0_C_P, Bank224_MGTREF1_C_N, Bank224_MGTREF1_C_P
differential pair; differential pair class Diff_100: B224_Rx0_N, B224_Rx0_P, B224_Rx1_N, B224_Rx1_P, B224_Rx2_N, B224_Rx2_P, B224_Rx3_N, B224_Rx3_P, B224_Tx0_to_C_N, B224_Tx0_to_C_P, B224_Tx0C_to_B_N, B224_Tx0C_to_B_P, B224_Tx1_to_C_N, B224_Tx1_to_C_P, B224_Tx1C_to_B_N, B224_Tx1C_to_B_P, B224_Tx2_to_C_N, B224_Tx2_to_C_P, B224_Tx2C_to_B_N, B224_Tx2C_to_B_P, B224_Tx3_to_C_N, B224_Tx3_to_C_P, B224_Tx3C_to_B_N, B224_Tx3C_to_B_P, Bank224_MGTREF0_C_N, Bank224_MGTREF0_C_P, Bank224_MGTREF0_N, Bank224_MGTREF0_P, Bank224_MGTREF1_C_N, Bank224_MGTREF1_C_P, Bank224_MGTREF1_N, Bank224_MGTREF1_P
net class Bank224_MGTREFx: Bank224_MGTREF0_N, Bank224_MGTREF0_P, Bank224_MGTREF1_N, Bank224_MGTREF1_P

### Notes on the sheet
- Title
- Size:
- Date:
- A3
- Number:
- Time:
- Revision:
- Sheet
- of
- File:
- (in symbol FBVB900, part C) Bank 224

### Library data of the parts
C279-C284 C286 C287 = Capacitor: CAP CER 0.1UF 16V X5R 0201; Manufacturer: Murata; Manufacturer Part Number: GRM033R61C104ME84D; Tolerance: 20%; Supplier 1: Digi-Key; Supplier Part Number 1: 490-9986-1-ND; RoHS: Yes; Category: Ceramic Capacitors; Stock 1: 519119; Pricing 1: 1=0,10000, 10=0,06000, 100=0,02670, 500=0,01906, 1000=0,01497, 2500=0,01361, 5000=0,01252 (USD); Mount: Surface Mount; Weight: 1.2E-05oz; Case Code (Metric): 0603; Min Operating Temperature: -55°C; Max Operating Temperature: 85°C; Capacitance: 100nF; Packaging: Tape and Reel; Voltage Rating: 16V; Dielectric: X5R; Termination: SMD/SMT; Voltage Rating (DC): 16V; Package Quantity: 15000; Length: 0.024inch; Height: 0.3mm; Width: 0.3mm; Thickness: 0.013inch; ComponentLink1URL: http://www.mouser.com/ds/2/281/c02e-2905.pdf?src-supplier=Mouser; ComponentLink1Description: http://www.mouser.com/ds/2/281/c02e-2905.pdf?src-supplier=Mouser; ComponentLink2URL: http://search.murata.co.jp/Ceramy/image/img/A01X/G101/ENG/GRM033R61C104ME84-01.pdf?src-supplier=Digi-Key; ComponentLink2Description: http://search.murata.co.jp/Ceramy/image/img/A01X/G101/ENG/GRM033R61C104ME84-01.pdf?src-supplier=Digi-Key
  C280 C282 C284 C287: Case Code (Imperial): 0201
C285 C288-C290 = Capacitor: CAP CER 10000PF 16V X7R 0201; Manufacturer: Murata; Manufacturer Part Number: GRM033R71C103KE14D; Tolerance: 10%; Supplier 1: Digi-Key; Supplier Part Number 1: 490-14453-1-ND; RoHS: No; Category: Ceramic Capacitors; Stock 1: 188777; Pricing 1: 1=0,10000, 10=0,01900, 100=0,00870, 500=0,00620, 1000=0,00487, 2500=0,00443, 5000=0,00407 (USD); Voltage Rating (DC): 16V; Dielectric: X7R; Capacitance: 10nF; Length: 600um; Width: 300um; Thickness: 300um; ComponentLink1URL: http://www.farnell.com/datasheets/2722745.pdf?src-supplier=Farnell; ComponentLink1Description: http://www.farnell.com/datasheets/2722745.pdf?src-supplier=Farnell; ComponentLink2URL: http://www.farnell.com/datasheets/2722745.pdf?src-supplier=Newark; ComponentLink2Description: http://www.farnell.com/datasheets/2722745.pdf?src-supplier=Newark; ComponentLink3URL: http://www.farnell.com/datasheets/2722745.pdf?src-supplier=Element14; ComponentLink3Description: http://www.farnell.com/datasheets/2722745.pdf?src-supplier=Element14; ComponentLink4URL: http://search.murata.co.jp/Ceramy/image/img/A01X/G101/ENG/GRM033R71C103KE14-01.pdf?src-supplier=Digi-Key; ComponentLink4Description: http://search.murata.co.jp/Ceramy/image/img/A01X/G101/ENG/GRM033R71C103KE14-01.pdf?src-supplier=Digi-Key
C686-C689 = Capacitor: as C54 on sheet LTC6952; Supplier 1: Digi-Key; Supplier Part Number 1: 490-14603-1-ND; Stock 1: 89275; Pricing 1: 1 = 0,10000, 10 = 0,03400, 100 = 0,01520, 500 = 0,01088, 1000 = 0,00855, 2500 = 0,00778, 5000 = 0,00715 (USD); RoHS: Yes; Mount: Surface Mount; Weight: 0.000212oz; Case Code (Imperial): 0402; Case Code (Metric): 1005; Min Operating Temperature: -55°C; Max Operating Temperature: 125°C; Packaging: Tape and Reel; Capacitance: 100nF; Termination: SMD/SMT; Composition: Ceramic; Voltage Rating (DC): 25V; Package Quantity: 50000; Length: 0.039inch; Height: 0.5mm; Width: 0.5mm; Thickness: 0.022inch; ComponentLink1URL: http://www.mouser.com/ds/2/281/c02e-2905.pdf?src-supplier=Mouser; ComponentLink1Description: http://www.mouser.com/ds/2/281/c02e-2905.pdf?src-supplier=Mouser; ComponentLink2URL: http://search.murata.co.jp/Ceramy/image/img/A01X/G101/ENG/GRM155R71E104KE14-01.pdf?src-supplier=Digi-Key; ComponentLink2Description: http://search.murata.co.jp/Ceramy/image/img/A01X/G101/ENG/GRM155R71E104KE14-01.pdf?src-supplier=Digi-Key
U1 = FBVB900: as U1 on sheet Ultrascale+_02; Supplier 1: Mouser; Supplier Part Number 1: 217-CZU4CG-1FBVB900E; Stock 1: 3; Pricing 1: 1=0,00000, 5=1060,70000 (USD); RoHS: No; Case/Package: FCBGA; Min Operating Temperature: 0°C; Max Operating Temperature: 100°C; Packaging: Tray; ComponentLink1URL: https://www.xilinx.com/support/documentation/data_sheets/ds891-zynq-ultrascale-plus-overview.pdf?src-supplier=Digi-Key; ComponentLink1Description: https://www.xilinx.com/support/documentation/data_sheets/ds891-zynq-ultrascale-plus-overview.pdf?src-supplier=Digi-Key; ComponentLink2URL: https://www.xilinx.com/support/documentation/data_sheets/ds925-zynq-ultrascale-plus.pdf?src-supplier=Digi-Key; ComponentLink2Description: https://www.xilinx.com/support/documentation/data_sheets/ds925-zynq-ultrascale-plus.pdf?src-supplier=Digi-Key; Supplier 2: Avnet; Supplier 3: Digi-Key; Supplier Part Number 2: XCZU4CG-1FBVB900E; Supplier Part Number 3: XCZU4CG-1FBVB900E-ND

## Sheet Bank225.SchDoc: Bank225
size A3; Organization: Altium Limited; Address1: L3, 12a Rodborough Rd; Address2: Frenchs Forest; Address3: NSW; Address4: Australia 2086
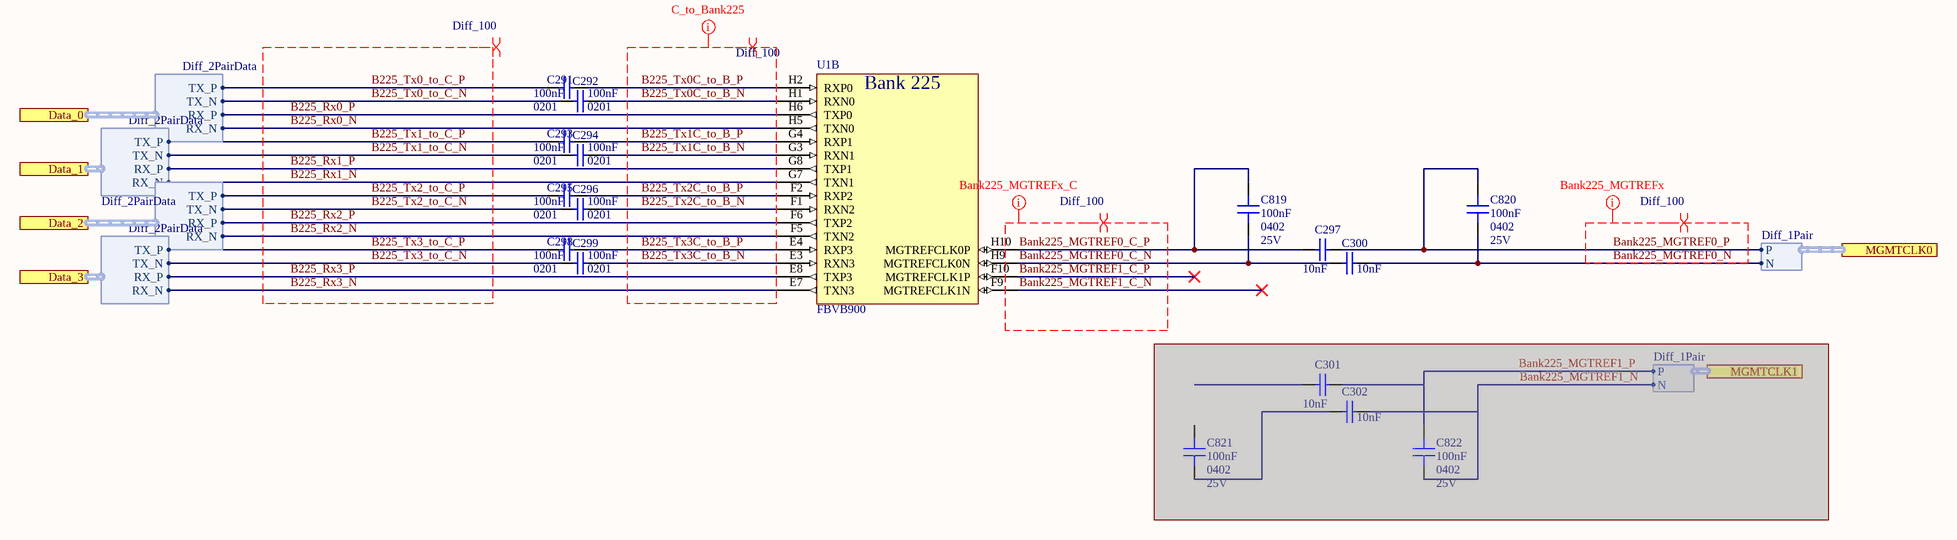
[diagram p14: Bank225.SchDoc]

### Parts
C291  100nF  Case/Package: 0201  [CAP 0201/0603 KK]
C292  100nF  Case/Package: 0201  [CAP 0201/0603 KK]
C293  100nF  Case/Package: 0201  [CAP 0201/0603 KK]
C294  100nF  Case/Package: 0201  [CAP 0201/0603 KK]
C295  100nF  Case/Package: 0201  [CAP 0201/0603 KK]
C296  100nF  Case/Package: 0201  [CAP 0201/0603 KK]
C297  10nF  [CAP 0201/0603 KK]
C298  100nF  Case/Package: 0201  [CAP 0201/0603 KK]
C299  100nF  Case/Package: 0201  [CAP 0201/0603 KK]
C300  10nF  [CAP 0201/0603 KK]
C301  10nF  [CAP 0201/0603 KK]  (masked out: inside a compile mask, not in the netlist)
C302  10nF  [CAP 0201/0603 KK]  (masked out: inside a compile mask, not in the netlist)
C819  100nF  Case/Package: 0402  Voltage Rating: 25V  [CAP 0402/1005 KK]
C820  100nF  Case/Package: 0402  Voltage Rating: 25V  [CAP 0402/1005 KK]
C821  100nF  Case/Package: 0402  Voltage Rating: 25V  [CAP 0402/1005 KK]  (masked out: inside a compile mask, not in the netlist)
C822  100nF  Case/Package: 0402  Voltage Rating: 25V  [CAP 0402/1005 KK]  (masked out: inside a compile mask, not in the netlist)
U1  FBVB900  [FBVB900 XX]  (part B of 23)

### Ports
Data_0 (harness Diff_2PairData), Data_1 (harness Diff_2PairData), Data_2 (harness Diff_2PairData), Data_3 (harness Diff_2PairData), MGMTCLK0 (harness Diff_1Pair), MGMTCLK1 (harness Diff_1Pair)

### Harnesses
Diff_1Pair: P, N
Diff_2PairData: RX_P, RX_N, TX_P, TX_N

### Nets
B225_Rx0_N: U1.H5(TXN0) ; port Data_0.RX_N
B225_Rx0_P: U1.H6(TXP0) ; port Data_0.RX_P
B225_Rx1_N: U1.G7(TXN1) ; port Data_1.RX_N
B225_Rx1_P: U1.G8(TXP1) ; port Data_1.RX_P
B225_Rx2_N: U1.F5(TXN2) ; port Data_2.RX_N
B225_Rx2_P: U1.F6(TXP2) ; port Data_2.RX_P
B225_Rx3_N: U1.E7(TXN3) ; port Data_3.RX_N
B225_Rx3_P: U1.E8(TXP3) ; port Data_3.RX_P
B225_Tx0_to_C_N: C292.1 ; port Data_0.TX_N
B225_Tx0_to_C_P: C291.1 ; port Data_0.TX_P
B225_Tx0C_to_B_N: C292.2 U1.H1(RXN0)
B225_Tx0C_to_B_P: C291.2 U1.H2(RXP0)
B225_Tx1_to_C_N: C294.1 ; port Data_1.TX_N
B225_Tx1_to_C_P: C293.1 ; port Data_1.TX_P
B225_Tx1C_to_B_N: C294.2 U1.G3(RXN1)
B225_Tx1C_to_B_P: C293.2 U1.G4(RXP1)
B225_Tx2_to_C_N: C296.1 ; port Data_2.TX_N
B225_Tx2_to_C_P: C295.1 ; port Data_2.TX_P
B225_Tx2C_to_B_N: C296.2 U1.F1(RXN2)
B225_Tx2C_to_B_P: C295.2 U1.F2(RXP2)
B225_Tx3_to_C_N: C299.1 ; port Data_3.TX_N
B225_Tx3_to_C_P: C298.1 ; port Data_3.TX_P
B225_Tx3C_to_B_N: C299.2 U1.E3(RXN3)
B225_Tx3C_to_B_P: C298.2 U1.E4(RXP3)
Bank225_MGTREF0_C_N: C300.1 C819.2 U1.H9(MGTREFCLK0N)
Bank225_MGTREF0_C_P: C297.1 C819.1 U1.H10(MGTREFCLK0P)
Bank225_MGTREF0_N: C300.2 C820.2 ; port MGMTCLK0.N
Bank225_MGTREF0_P: C297.2 C820.1 ; port MGMTCLK0.P
Bank225_MGTREF1_C_N: U1.F9(MGTREFCLK1N)
Bank225_MGTREF1_C_P: U1.F10(MGTREFCLK1P)

### Layout directives
net class C_to_Bank225: B225_Tx0C_to_B_N, B225_Tx0C_to_B_P, B225_Tx1C_to_B_N, B225_Tx1C_to_B_P, B225_Tx2C_to_B_N, B225_Tx2C_to_B_P, B225_Tx3C_to_B_N, B225_Tx3C_to_B_P
net class Bank225_MGTREFx_C: Bank225_MGTREF0_C_N, Bank225_MGTREF0_C_P, Bank225_MGTREF1_C_N, Bank225_MGTREF1_C_P
differential pair; differential pair class Diff_100: B225_Rx0_N, B225_Rx0_P, B225_Rx1_N, B225_Rx1_P, B225_Rx2_N, B225_Rx2_P, B225_Rx3_N, B225_Rx3_P, B225_Tx0_to_C_N, B225_Tx0_to_C_P, B225_Tx0C_to_B_N, B225_Tx0C_to_B_P, B225_Tx1_to_C_N, B225_Tx1_to_C_P, B225_Tx1C_to_B_N, B225_Tx1C_to_B_P, B225_Tx2_to_C_N, B225_Tx2_to_C_P, B225_Tx2C_to_B_N, B225_Tx2C_to_B_P, B225_Tx3_to_C_N, B225_Tx3_to_C_P, B225_Tx3C_to_B_N, B225_Tx3C_to_B_P, Bank225_MGTREF0_C_N, Bank225_MGTREF0_C_P, Bank225_MGTREF0_N, Bank225_MGTREF0_P, Bank225_MGTREF1_C_N, Bank225_MGTREF1_C_P
net class Bank225_MGTREFx: Bank225_MGTREF0_N, Bank225_MGTREF0_P

### Notes on the sheet
- Title
- Size:
- Date:
- A3
- Number:
- Time:
- Revision:
- Sheet
- of
- File:
- (in symbol FBVB900, part B) Bank 225

### Library data of the parts
C291-C296 C298 C299 = Capacitor: as C279 on sheet Bank224; Supplier 1: Digi-Key; Supplier Part Number 1: 490-9986-1-ND; RoHS: Yes; Category: Ceramic Capacitors; Stock 1: 519119; Pricing 1: 1=0,10000, 10=0,06000, 100=0,02670, 500=0,01906, 1000=0,01497, 2500=0,01361, 5000=0,01252 (USD); Mount: Surface Mount; Weight: 1.2E-05oz; Case Code (Metric): 0603; Min Operating Temperature: -55°C; Max Operating Temperature: 85°C; Capacitance: 100nF; Packaging: Tape and Reel; Voltage Rating: 16V; Dielectric: X5R; Termination: SMD/SMT; Voltage Rating (DC): 16V; Package Quantity: 15000; Length: 0.024inch; Height: 0.3mm; Width: 0.3mm; Thickness: 0.013inch; ComponentLink1URL: http://www.mouser.com/ds/2/281/c02e-2905.pdf?src-supplier=Mouser; ComponentLink1Description: http://www.mouser.com/ds/2/281/c02e-2905.pdf?src-supplier=Mouser; ComponentLink2URL: http://search.murata.co.jp/Ceramy/image/img/A01X/G101/ENG/GRM033R61C104ME84-01.pdf?src-supplier=Digi-Key; ComponentLink2Description: http://search.murata.co.jp/Ceramy/image/img/A01X/G101/ENG/GRM033R61C104ME84-01.pdf?src-supplier=Digi-Key
  C292 C294 C296 C299: Case Code (Imperial): 0201
C297 C300-C302 = Capacitor: as C285 on sheet Bank224; Supplier 1: Digi-Key; Supplier Part Number 1: 490-14453-1-ND; RoHS: No; Category: Ceramic Capacitors; Stock 1: 188777; Pricing 1: 1=0,10000, 10=0,01900, 100=0,00870, 500=0,00620, 1000=0,00487, 2500=0,00443, 5000=0,00407 (USD); Voltage Rating (DC): 16V; Dielectric: X7R; Capacitance: 10nF; Length: 600um; Width: 300um; Thickness: 300um; ComponentLink1URL: http://www.farnell.com/datasheets/2722745.pdf?src-supplier=Farnell; ComponentLink1Description: http://www.farnell.com/datasheets/2722745.pdf?src-supplier=Farnell; ComponentLink2URL: http://www.farnell.com/datasheets/2722745.pdf?src-supplier=Newark; ComponentLink2Description: http://www.farnell.com/datasheets/2722745.pdf?src-supplier=Newark; ComponentLink3URL: http://www.farnell.com/datasheets/2722745.pdf?src-supplier=Element14; ComponentLink3Description: http://www.farnell.com/datasheets/2722745.pdf?src-supplier=Element14; ComponentLink4URL: http://search.murata.co.jp/Ceramy/image/img/A01X/G101/ENG/GRM033R71C103KE14-01.pdf?src-supplier=Digi-Key; ComponentLink4Description: http://search.murata.co.jp/Ceramy/image/img/A01X/G101/ENG/GRM033R71C103KE14-01.pdf?src-supplier=Digi-Key
C819-C822 = Capacitor: as C54 on sheet LTC6952; Supplier 1: Digi-Key; Supplier Part Number 1: 490-14603-1-ND; Stock 1: 89275; Pricing 1: 1 = 0,10000, 10 = 0,03400, 100 = 0,01520, 500 = 0,01088, 1000 = 0,00855, 2500 = 0,00778, 5000 = 0,00715 (USD); RoHS: Yes; Mount: Surface Mount; Weight: 0.000212oz; Case Code (Imperial): 0402; Case Code (Metric): 1005; Min Operating Temperature: -55°C; Max Operating Temperature: 125°C; Packaging: Tape and Reel; Capacitance: 100nF; Termination: SMD/SMT; Composition: Ceramic; Voltage Rating (DC): 25V; Package Quantity: 50000; Length: 0.039inch; Height: 0.5mm; Width: 0.5mm; Thickness: 0.022inch; ComponentLink1URL: http://www.mouser.com/ds/2/281/c02e-2905.pdf?src-supplier=Mouser; ComponentLink1Description: http://www.mouser.com/ds/2/281/c02e-2905.pdf?src-supplier=Mouser; ComponentLink2URL: http://search.murata.co.jp/Ceramy/image/img/A01X/G101/ENG/GRM155R71E104KE14-01.pdf?src-supplier=Digi-Key; ComponentLink2Description: http://search.murata.co.jp/Ceramy/image/img/A01X/G101/ENG/GRM155R71E104KE14-01.pdf?src-supplier=Digi-Key
U1 = FBVB900: as U1 on sheet Ultrascale+_02; Supplier 1: Mouser; Supplier Part Number 1: 217-CZU4CG-1FBVB900E; Stock 1: 3; Pricing 1: 1=0,00000, 5=1060,70000 (USD); RoHS: No; Case/Package: FCBGA; Min Operating Temperature: 0°C; Max Operating Temperature: 100°C; Packaging: Tray; ComponentLink1URL: https://www.xilinx.com/support/documentation/data_sheets/ds891-zynq-ultrascale-plus-overview.pdf?src-supplier=Digi-Key; ComponentLink1Description: https://www.xilinx.com/support/documentation/data_sheets/ds891-zynq-ultrascale-plus-overview.pdf?src-supplier=Digi-Key; ComponentLink2URL: https://www.xilinx.com/support/documentation/data_sheets/ds925-zynq-ultrascale-plus.pdf?src-supplier=Digi-Key; ComponentLink2Description: https://www.xilinx.com/support/documentation/data_sheets/ds925-zynq-ultrascale-plus.pdf?src-supplier=Digi-Key; Supplier 2: Avnet; Supplier 3: Digi-Key; Supplier Part Number 2: XCZU4CG-1FBVB900E; Supplier Part Number 3: XCZU4CG-1FBVB900E-ND